# Altium schematic sheet POV_Display.SchDoc
size A4; SheetNumber: 1; SheetTotal: 4
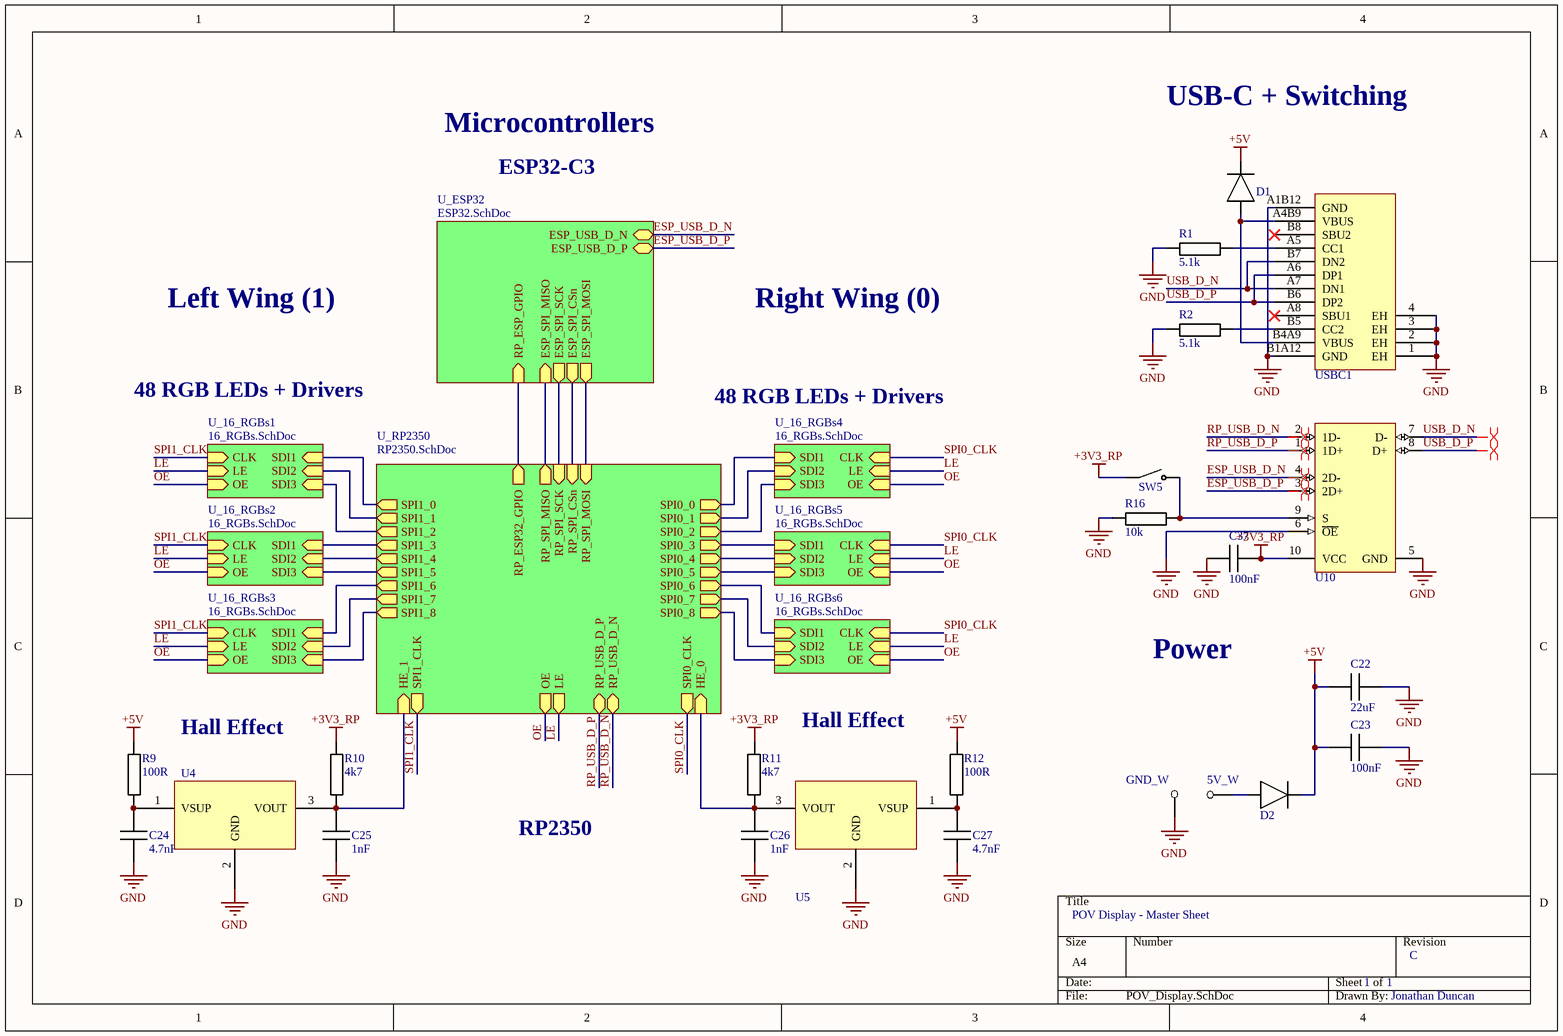
[diagram p0: POV_Display.SchDoc]

## Parts
5V_W  Wireless +5V input  [THT 100mil pad-Footprint-1]  (value not drawn)  (no BOM)
C22  value 22uF  [FP-CC0603-DA-IPC_B]  (hidden comment: Cap 22uF 0603)
C23  value 100nF  [FP-CC0603-DA-IPC_B]  (hidden comment: Cap 100nF 0603)
C24  value 4.7nF  [FP-CC0603-DA-IPC_B]  (hidden comment: Cap 4.7nF 0603)
C25  value 1nF  [FP-CC0603-DA-IPC_B]  (hidden comment: Cap 1nF 0603)
C26  value 1nF  [FP-CC0603-DA-IPC_B]  (hidden comment: Cap 1nF 0603)
C27  value 4.7nF  [FP-CC0603-DA-IPC_B]  (hidden comment: Cap 4.7nF 0603)
C37  value 100nF  [FP-CC0603-DA-IPC_B]  (hidden comment: Cap 100nF 0603)
D1  MBRA140T3G  [ONSC-SMA-2-403D-02_V]  (value not drawn)
D2  MBRA140T3G  [ONSC-SMA-2-403D-02_V]  (value not drawn)
GND_W  Wireless ground  [THT 100mil pad-Footprint-1]  (value not drawn)  (no BOM)
R1  value 5.1k  [FP-RC0603-0_55-IPC_B]  (hidden comment: Res 5k1 0603)
R2  value 5.1k  [FP-RC0603-0_55-IPC_B]  (hidden comment: Res 5k1 0603)
R9  value 100R  [FP-RC0603-0_55-IPC_B]  (hidden comment: Res 100R 0603)
R10  value 4k7  [FP-RC0603-0_55-IPC_B]  (hidden comment: Res 4k7 0603)
R11  value 4k7  [FP-RC0603-0_55-IPC_B]  (hidden comment: Res 4k7 0603)
R12  value 100R  [FP-RC0603-0_55-IPC_B]  (hidden comment: Res 100R 0603)
R16  value 10k  [FP-RC0603-0_55-IPC_B]  (hidden comment: Res 10k 0603)
SW5  2.54-1P TPGT  [2.54-1P TPGT-Footprint-1]  (value not drawn)
U4  JSMSEMI A3144E-JSM  [JSMSEMI A3144E-JSM-Footprint-1]  (value not drawn)
U5  JSMSEMI A3144E-JSM  [JSMSEMI A3144E-JSM-Footprint-1]  (value not drawn)
U10  TS3USB221RSER  [RSE0010A_V]  (value not drawn)
USBC1  TYPE-C-31-M-12  [TYPE-C-31-M-12-Footprint-1]  (value not drawn)

## Sub-sheets
U_16_RGBs1 = 16_RGBs.SchDoc: CLK (in), LE (in), OE (in), SDI1 (in), SDI2 (in), SDI3 (in)
U_16_RGBs2 = 16_RGBs.SchDoc: CLK (in), LE (in), OE (in), SDI1 (in), SDI2 (in), SDI3 (in)
U_16_RGBs3 = 16_RGBs.SchDoc: CLK (in), LE (in), OE (in), SDI1 (in), SDI2 (in), SDI3 (in)
U_16_RGBs4 = 16_RGBs.SchDoc: CLK (in), LE (in), OE (in), SDI1 (in), SDI2 (in), SDI3 (in)
U_16_RGBs5 = 16_RGBs.SchDoc: CLK (in), LE (in), OE (in), SDI1 (in), SDI2 (in), SDI3 (in)
U_16_RGBs6 = 16_RGBs.SchDoc: CLK (in), LE (in), OE (in), SDI1 (in), SDI2 (in), SDI3 (in)
U_ESP32 = ESP32.SchDoc: RP_ESP_GPIO (in), ESP_SPI_MISO (in), ESP_SPI_SCK (out), ESP_SPI_CSn (out), ESP_USB_D_N (bidir), ESP_USB_D_P (bidir), ESP_SPI_MOSI (out)
U_RP2350 = RP2350.SchDoc: RP_SPI_MOSI (in), RP_SPI_CSn (in), RP_ESP32_GPIO (out), RP_SPI_SCK (in), RP_SPI_MISO (out), SPI1_0 (out), SPI1_1 (out), SPI1_2 (out), SPI1_3 (out), SPI1_4 (out), SPI1_5 (out), SPI1_6 (out), SPI1_7 (out), SPI1_8 (out), SPI0_0 (out), SPI0_1 (out), SPI0_2 (out), SPI0_3 (out), SPI0_4 (out), SPI0_5 (out), SPI0_6 (out), SPI0_7 (out), SPI0_8 (out), LE (out), OE (out), HE_0 (in), SPI0_CLK (out), SPI1_CLK (out), HE_1 (in), RP_USB_D_P (bidir), RP_USB_D_N (bidir)

## Nets
+3V3_RP: C37.2 R10.2 R11.2 SW5.1 U10.10(VCC)
+5V: C22.1 C23.1 D1.1(K) D2.1(K) R9.2 R12.2
GND: C22.2 C23.2 C24.1 C25.1 C26.1 C27.1 C37.1 GND_W.1 R1.1 R2.1 R16.1 U4.2(GND) U5.2(GND) U10.5(GND) U10.6(~{OE}) USBC1.1(EH) USBC1.2(EH) USBC1.3(EH) USBC1.4(EH) USBC1.A1B12(GND) USBC1.B1A12(GND)
ESP_USB_D_N: U10.4(2D-) ; sheet U_ESP32/ESP_USB_D_N
ESP_USB_D_P: U10.3(2D+) ; sheet U_ESP32/ESP_USB_D_P
LE: sheet U_16_RGBs1/LE, sheet U_RP2350/LE, sheet U_16_RGBs2/LE, sheet U_16_RGBs3/LE, sheet U_16_RGBs4/LE, sheet U_16_RGBs5/LE, sheet U_16_RGBs6/LE
OE: sheet U_16_RGBs1/OE, sheet U_RP2350/OE, sheet U_16_RGBs2/OE, sheet U_16_RGBs3/OE, sheet U_16_RGBs4/OE, sheet U_16_RGBs5/OE, sheet U_16_RGBs6/OE
RP_USB_D_N: U10.2(1D-) ; sheet U_RP2350/RP_USB_D_N
RP_USB_D_P: U10.1(1D+) ; sheet U_RP2350/RP_USB_D_P
SPI0_CLK: sheet U_RP2350/SPI0_CLK, sheet U_16_RGBs4/CLK, sheet U_16_RGBs5/CLK, sheet U_16_RGBs6/CLK
SPI1_CLK: sheet U_16_RGBs1/CLK, sheet U_RP2350/SPI1_CLK, sheet U_16_RGBs2/CLK, sheet U_16_RGBs3/CLK
USB_D_N: U10.7(D-) USBC1.A7(DN1) USBC1.B7(DN2)
USB_D_P: U10.8(D+) USBC1.A6(DP1) USBC1.B6(DP2)
Net5V_W_1: 5V_W.1 D2.2(A)
NetC24_2: C24.2 R9.1 U4.1(VSUP)
NetC25_2: C25.2 R10.1 U4.3(VOUT) ; sheet U_RP2350/HE_1
NetC26_2: C26.2 R11.1 U5.3(VOUT) ; sheet U_RP2350/HE_0
NetC27_2: C27.2 R12.1 U5.1(VSUP)
NetD1_2: D1.2(A) USBC1.A4B9(VBUS) USBC1.B4A9(VBUS)
NetR1_2: R1.2 USBC1.A5(CC1)
NetR2_2: R2.2 USBC1.B5(CC2)
NetR16_2: R16.2 SW5.2 U10.9(S)
(unnamed): sheet U_16_RGBs1/SDI1, sheet U_RP2350/SPI1_0
(unnamed): sheet U_16_RGBs1/SDI2, sheet U_RP2350/SPI1_1
(unnamed): sheet U_16_RGBs1/SDI3, sheet U_RP2350/SPI1_2
(unnamed): sheet U_RP2350/RP_SPI_MOSI, sheet U_ESP32/ESP_SPI_MOSI
(unnamed): sheet U_RP2350/RP_SPI_CSn, sheet U_ESP32/ESP_SPI_CSn
(unnamed): sheet U_RP2350/RP_ESP32_GPIO, sheet U_ESP32/RP_ESP_GPIO
(unnamed): sheet U_RP2350/RP_SPI_SCK, sheet U_ESP32/ESP_SPI_SCK
(unnamed): sheet U_RP2350/RP_SPI_MISO, sheet U_ESP32/ESP_SPI_MISO
(unnamed): sheet U_RP2350/SPI1_3, sheet U_16_RGBs2/SDI1
(unnamed): sheet U_RP2350/SPI1_4, sheet U_16_RGBs2/SDI2
(unnamed): sheet U_RP2350/SPI1_5, sheet U_16_RGBs2/SDI3
(unnamed): sheet U_RP2350/SPI1_6, sheet U_16_RGBs3/SDI1
(unnamed): sheet U_RP2350/SPI1_7, sheet U_16_RGBs3/SDI2
(unnamed): sheet U_RP2350/SPI1_8, sheet U_16_RGBs3/SDI3
(unnamed): sheet U_RP2350/SPI0_0, sheet U_16_RGBs4/SDI1
(unnamed): sheet U_RP2350/SPI0_1, sheet U_16_RGBs4/SDI2
(unnamed): sheet U_RP2350/SPI0_2, sheet U_16_RGBs4/SDI3
(unnamed): sheet U_RP2350/SPI0_3, sheet U_16_RGBs5/SDI1
(unnamed): sheet U_RP2350/SPI0_4, sheet U_16_RGBs5/SDI2
(unnamed): sheet U_RP2350/SPI0_5, sheet U_16_RGBs5/SDI3
(unnamed): sheet U_RP2350/SPI0_6, sheet U_16_RGBs6/SDI1
(unnamed): sheet U_RP2350/SPI0_7, sheet U_16_RGBs6/SDI2
(unnamed): sheet U_RP2350/SPI0_8, sheet U_16_RGBs6/SDI3

Not connected (* = marked no-connect by the designer): USBC1 A8(SBU1)* B8(SBU2)*

## Layout directives
differential pair: ESP_USB_D_N, ESP_USB_D_P, RP_USB_D_N, RP_USB_D_P, USB_D_N, USB_D_P

## Notes on the sheet
- USB-C + Switching
- Microcontrollers
- ESP32-C3
- Left Wing (1)
- Right Wing (0)
- 48 RGB LEDs + Drivers
- Power
- Hall Effect
- RP2350
- POV Display - Master Sheet
- 1
- C
- Jonathan Duncan

## Library data of the parts
5V_W GND_W = CMP-00020-1: 40mil hole, 100mil pad THT; Hole Diameter: 40mil; Pad Diameter: 100mil
C22 = CMP-001-00003-1: 22uF 6.3V 20% X5R 0603 SMD Capacitor; Case/Package: 0603; Mounting Technology: SMT; Voltage Rating: 6.3V; Tolerance: 20%; Temperature Coefficient: X5R
C23 C37 = CMP-00006-5: 100nF 50V 10% X7R 0603 SMD Capacitor Decoupling; Temperature Coefficient: X7R; Mounting Technology: SMT; Tolerance: 10%; Case/Package: 0603; Voltage Rating: 50V
C24 C27 = CMP-001-00007-1: 4.7nF 50V 10% X7R 0603 SMD Capacitor; Case/Package: 0603; Temperature Coefficient: X7R; Mounting Technology: SMT; Tolerance: 10%; Voltage Rating: 50V
C25 C26 = CMP-001-00006-2: 1nF 50V 10% X7R 0603 SMD Capacitor; Voltage Rating: 50V; Case/Package: 0603; Temperature Coefficient: X7R; Mounting Technology: SMT; Tolerance: 10%
D1 D2 = CMP-00016-2: Schottky Barrier Rectifier Diode 40 Volt 1A Automotive 2-Pin SMA
R1 R2 = CMP-009-00005-1: 5.1k 1% 100mW 0603 SMD Resistor; Power Rating: 100mW; Mounting Technology: SMT; Tolerance: 1%; Case/Package: 0603
R9 R12 = CMP-009-00020-1: 100R 1% 100mW 0603 SMD Resistor; Case/Package: 0603; Tolerance: 1%; Mounting Technology: SMT; Power Rating: 100mW
R10 R11 = CMP-009-00019-1: 4.7k 1% 100mW 0603 SMD Resistor; Case/Package: 0603; Mounting Technology: SMT; Tolerance: 1%; Power Rating: 100mW
R16 = CMP-009-00000-1: 10k 1% 100mW 0603 SMD Resistor; Case/Package: 0603; Power Rating: 100mW; Mounting Technology: SMT; Tolerance: 1%
SW5 = CMP-002-000003-2: 1 Digit SPST 24V Black 25mA 3000 times Flat Toggle, Raised Style SMD DIP Switches ROHS
U4 U5 = CMP-00017-3: High-voltage-resistant and high-sensitivity unipolar Hall switch
U10 = CMP-00033-1: IC Usb Switch Dual 1X2 10UQFN Usb Switch IC 2 Channel 10-UQFN (2.0X1.5); Case/Package: QFN
USBC1 = CMP-00002-4: USB Type-C Connector Female SMD 16 pin; Current Rating: 5A; Gender: Female; Mounting Technology: SMT